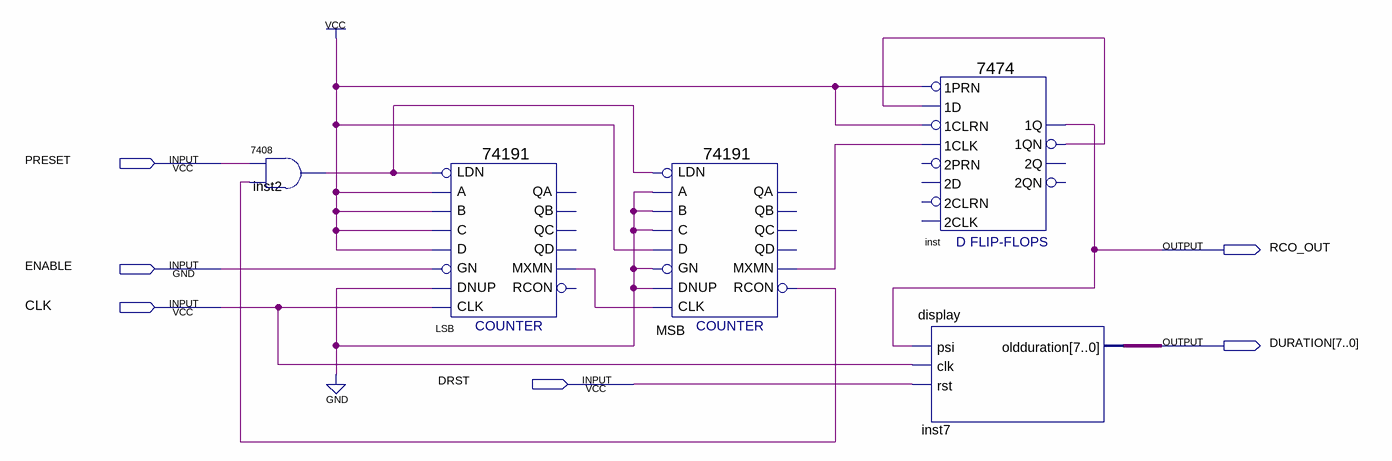
[diagram p0: schematic sheet]
// Quartus schematic freq_divider_113.bdf as structural Verilog: 5 symbols, 6 pins
module freq_divider_113 (
  input  PRESET,
  input  ENABLE,
  input  CLK,
  input  DRST,
  output RCO_OUT,
  output [7:0] DURATION
);

  wire inst2_1, inst_1qn, LSB_mxmn, MSB_mxmn, MSB_rcon;

  \7408  inst2 (.\3 (MSB_rcon), .\2 (PRESET), .\1 (inst2_1));
  \74191  LSB (
    .LDN(inst2_1), .D(1'b1), .C(1'b1), .B(1'b1), .A(1'b1), .CLK(CLK), .DNUP(1'b0), .GN(ENABLE),
    .MXMN(LSB_mxmn));  // open: RCON, QA, QB, QD, QC
  \74191  MSB (
    .LDN(inst2_1), .D(1'b1), .C(1'b0), .B(1'b0), .A(1'b0), .CLK(LSB_mxmn), .DNUP(1'b0), .GN(1'b0),
    .RCON(MSB_rcon), .MXMN(MSB_mxmn));  // open: QA, QB, QD, QC
  \7474  inst (
    .\1CLK (MSB_mxmn), .\1D (inst_1qn), .\1PRN (1'b1), .\1CLRN (1'b1), .\1QN (inst_1qn), .\1Q (RCO_OUT));  // open: 2D, 2PRN, 2CLK, 2CLRN, 2Q, 2QN
  display inst7 (.psi(RCO_OUT), .clk(CLK), .rst(DRST), .oldduration(DURATION));
endmodule
